# Altium schematic sheet STM32G474RBT6.SchDoc
size A3; SheetNumber: 2; SheetTotal: 4
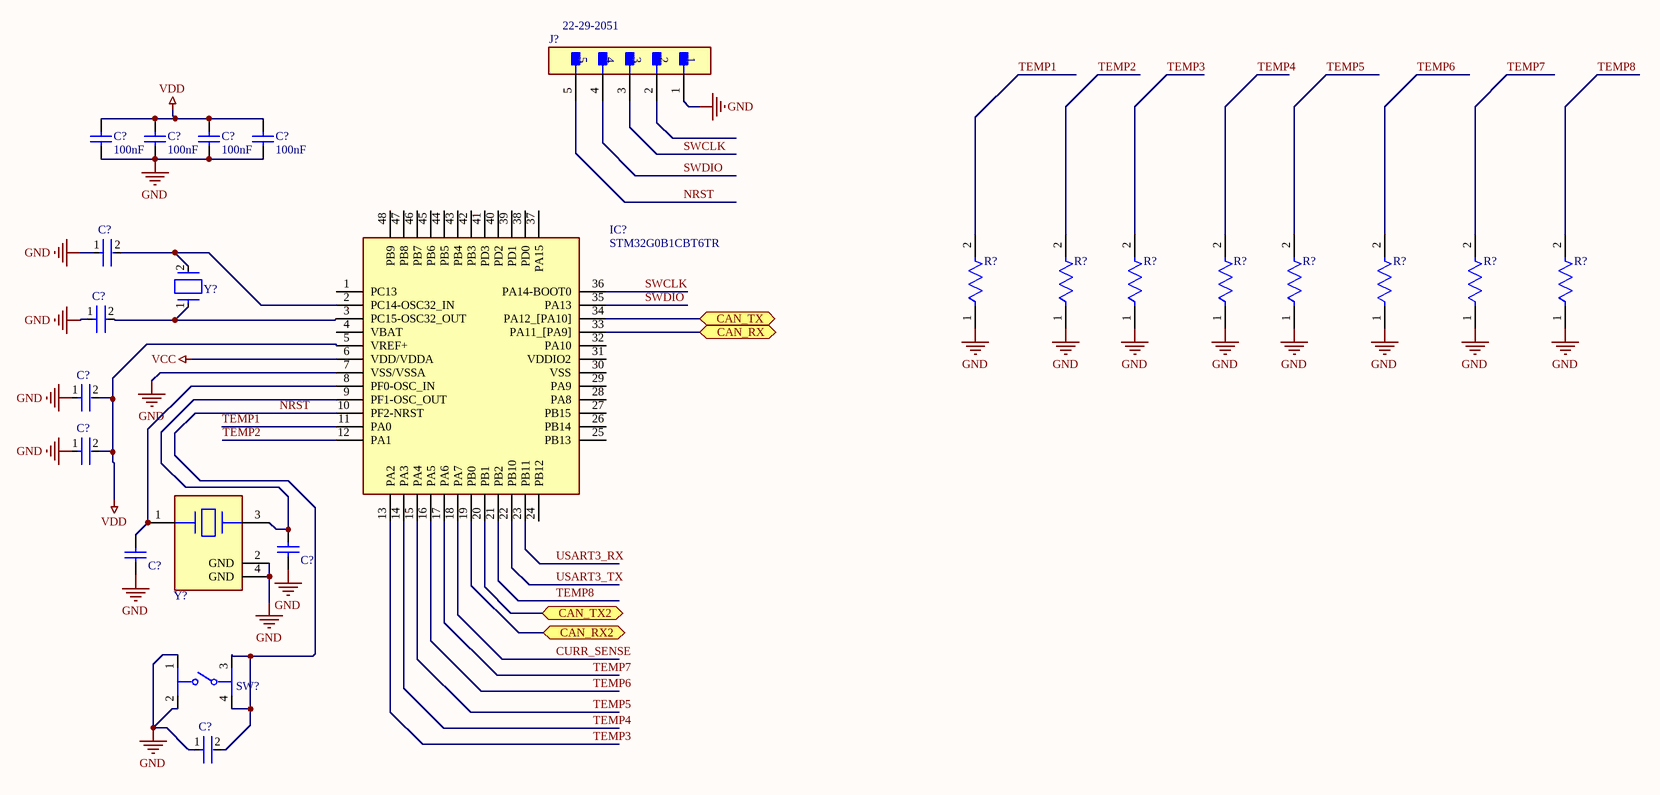
[diagram p0: STM32G474RBT6.SchDoc]

## Parts
(Parts that share a designator on the sheet are numbered #1, #2 ... from top to bottom, then left to right.)
C?#1  value 100nF  [C0402]
C?#2  value 100nF  [C0402]
C?#3  value 100nF  [C0402]
C?#4  value 100nF  [C0402]
C?#5  C0805C519D3HACTU  [FP-C0805C-DN-MFG]  (value not drawn)
C?#6  C0805C519D3HACTU  [FP-C0805C-DN-MFG]  (value not drawn)
C?#7  C0805C104K5RACTU  [FP-C0805C-DN-MFG]  (value not drawn)
C?#8  C0805C104K5RACTU  [FP-C0805C-DN-MFG]  (value not drawn)
C?#9  GRM1885C1H100JA01D  [CAPC1608X90X35LL10T15]  (value not drawn)
C?#10  GRM1885C1H100JA01D  [CAPC1608X90X35LL10T15]  (value not drawn)
C?#11  C0805C104K5RACTU  [FP-C0805C-DN-MFG]  (value not drawn)
IC?  STM32G0B1CBT6TR  [QFP50P900X900X160-48N]
J?  22-29-2051  [FP-22-29-2051-MFG]
R?#1  CRGCQ0805J10K  [FP-CRGCQ0805-IPC_C]  (value not drawn)
R?#2  CRGCQ0805J10K  [FP-CRGCQ0805-IPC_C]  (value not drawn)
R?#3  CRGCQ0805J10K  [FP-CRGCQ0805-IPC_C]  (value not drawn)
R?#4  CRGCQ0805J10K  [FP-CRGCQ0805-IPC_C]  (value not drawn)
R?#5  CRGCQ0805J10K  [FP-CRGCQ0805-IPC_C]  (value not drawn)
R?#6  CRGCQ0805J10K  [FP-CRGCQ0805-IPC_C]  (value not drawn)
R?#7  CRGCQ0805J10K  [FP-CRGCQ0805-IPC_C]  (value not drawn)
R?#8  CRGCQ0805J10K  [FP-CRGCQ0805-IPC_C]  (value not drawn)
SW?  PTS647SK38SMTR2LFS  [FP-PTS647SK38SMTR2LFS-MFG]  (value not drawn)
Y?#1  ABS06-32.768KHZ-9-1-T  [FP-ABS06-MFG]  (value not drawn)
Y?#2  ABM8G-24.000MHZ-B4Y-T  [FP-ABM8G-MFG]  (value not drawn)

## Ports
CAN_RX2 (bidir), CAN_RX (bidir), CAN_TX2 (bidir), CAN_TX (bidir)

## Nets
GND: C?#1.1 C?#2.1 C?#3.1 C?#4.1 C?#5.1 C?#6.1 C?#7.1 C?#8.1 C?#9.1 C?#10.1 C?#11.1 IC?.7(VSS/VSSA) J?.1 R?#1.1 R?#2.1 R?#3.1 R?#4.1 R?#5.1 R?#6.1 R?#7.1 R?#8.1 SW?.1 SW?.2 Y?#2.2(GND) Y?#2.4(GND)
VCC: IC?.6(VDD/VDDA)
VDD: C?#1.2 C?#2.2 C?#3.2 C?#4.2 C?#7.2 C?#8.2 IC?.5(VREF+)
CAN_RX: IC?.33(PA11_[PA9]) ; port CAN_RX
CAN_RX2: IC?.19(PB0) ; port CAN_RX2
CAN_TX: IC?.34(PA12_[PA10]) ; port CAN_TX
CAN_TX2: IC?.20(PB1) ; port CAN_TX2
CURR_SENSE: IC?.18(PA7)
NRST: C?#11.2 IC?.10(PF2-NRST) J?.5 SW?.3 SW?.4
SWCLK: IC?.36(PA14-BOOT0) J?.3
SWDIO: IC?.35(PA13) J?.4
TEMP1: IC?.11(PA0) R?#1.2
TEMP2: IC?.12(PA1) R?#2.2
TEMP3: IC?.13(PA2) R?#3.2
TEMP4: IC?.14(PA3) R?#4.2
TEMP5: IC?.15(PA4) R?#5.2
TEMP6: IC?.16(PA5) R?#6.2
TEMP7: IC?.17(PA6) R?#7.2
TEMP8: IC?.21(PB2) R?#8.2
USART3_RX: IC?.23(PB11)
USART3_TX: IC?.22(PB10)
NetC?#5_2: C?#5.2 IC?.2(PC14-OSC32_IN) Y?#1.2
NetC?#6_2: C?#6.2 IC?.3(PC15-OSC32_OUT) Y?#1.1
NetC?#9_2: C?#9.2 IC?.9(PF1-OSC_OUT) Y?#2.3
NetC?#10_2: C?#10.2 IC?.8(PF0-OSC_IN) Y?#2.1

Not connected (* = marked no-connect by the designer): IC? 1(PC13) 4(VBAT) 24(PB12) 25(PB13) 26(PB14) 27(PB15) 28(PA8) 29(PA9) 30(VSS) 31(VDDIO2) 32(PA10) 37(PA15) 38(PD0) 39(PD1) 40(PD2) 41(PD3) 42(PB3) 43(PB4) 44(PB5) 45(PB6) 46(PB7) 47(PB8) 48(PB9); J? 2

## Library data of the parts
C?#1-C?#4 = MCD-00102: Capacitor, MLCC, 100nF, 16V, X7R, 10%, 0402, T=0,5mm; Manufacturer_Part_Number: CC0402KRX7R7BB104; Manufacturer: YAGEO; Provided_By: Subcon; Initial_Board_Reference: MB1262; Internal_Part_Number: MCD-00102; Status: Released; Package: C0402; ComponentLink1Description: Yageo_Capacitor_X7R-series.pdf; ECCN_US: n/a; ECCN_EU: n/a; Part_Type: Capacitor; ComponentLink1URL: http://tunmcdsvn.tun.st.com/Component_Datasheet_Library/Trunk/Capacitors/Yageo_Multilayer_Capacitor_X7R_series_100pF_to_22uF
C?#5 C?#6 = CMP-03020-033346-1: C0805 5.1 pF X8R 30ppm/°C 0.5 pF 25 V; Manufacturer: KEMET; Voltage Rating: 25 V; Tolerance: 0.5 pF; Capacitance: 5.1 pF; Value: 5.1 pF; Material: Ceramic; Category: Cap; Lead Free: Yes; Temperature Characteristic: X8R; Manufacturer Part Number: C0805C519D3HACTU; Ipc Land Pattern Name: CAPC200125X78; ComponentLink2Description: Datasheet; Package: C0805C-DN; Device Class L2: Capacitors; Automotive: No; Octopart: https://octopart.com/c0805c519d3hactu-kemet-88727353; Device Class L1: Passive Components; Temperature Coefficient: 30ppm/°C; Temperature Range High: +125°C; Height: 0.88mm; Temperature Range Low: -55°C; ComponentLink2URL: https://content.kemet.com/datasheets/KEM_C1003_C0G_SMD.pdf; Device Class L3: Ceramic Capacitors; RoHS: TRUE; Temperature: -55°C to +125°C
C?#7 C?#8 C?#11 = CMP-2007-00279-2: CAP CER 0.1UF 50V X7R 0805; Manufacturer: KEMET; Value: 0.10 μF; Tolerance: 0.1; Temperature Coefficient: 30ppm/°C; Material: Ceramic; Manufacturer Part Number: C0805C104K5RACTU; Device Class L2: Capacitors; Temperature Range Low: -55°C; Voltage Rating: 50 V; Digikey Description: CAP CER 0.1UF 50V X7R 0805; Category: Cap; ComponentLink2Description: Datasheet; Octopart: https://octopart.com/c0805c104k5ractu-kemet-143926; RoHS: TRUE; ComponentLink2URL: https://content.kemet.com/datasheets/KEM_C1003_C0G_SMD.pdf; Temperature Characteristic: X7R; Temperature: -55°C to +125°C; Height: 0.88mm; Temperature Range High: +125°C; Device Class L1: Passive Components; Automotive: No; Lead Free: Yes; Ipc Land Pattern Name: CAPC200125X78; Device Class L3: Ceramic Capacitors; Mouser Description: Cap Ceramic 0.1uF 50V X7R 10% SMD 2.0 x 1.2 mm 125 C Paper T/R; Capacitance: 0.10 μF; Package: C0805C-DN
C?#9 C?#10 = CMP-2006-02592-1: Manufacturer: Murata; Part Number: GRM1885C1H100JA01D
IC? = STM32G0B1CBT6TR: Integrated Circuit; Manufacturer_Name: STMicroelectronics; Datasheet Link: https://www.st.com/resource/en/datasheet/stm32g0b1cc.pdf; Height: 1.6mm; Manufacturer_Part_Number: STM32G0B1CBT6TR; Mouser Part Number: 511-STM32G0B1CBT6TR; Mouser Price/Stock: https://www.mouser.co.uk/ProductDetail/STMicroelectronics/STM32G0B1CBT6TR?qs=HoCaDK9Nz5cqFCA6TLpp%252Bw%3D%3D; Arrow Part Number: STM32G0B1CBT6TR; Arrow Price/Stock: https://www.arrow.com/en/products/stm32g0b1cbt6tr/stmicroelectronics?utm_currency=USD&region=nac
J? = CMP-04776-000816-1: 2.54MM KK HDR VT FRICLK VRA .5AU; Manufacturer: Molex; Number of Circuits: 5; Connector Type: Male Pin; Max Current Rating: 7A; Glow Wire Compliant: Non-compliant; Insulation Resistance: 50GR; Gender: Male; Current Rating: 4A; Number of Lines: 1; Max Voltage Rating (AC): 250V; Contact Resistance: 10mR; Orientation: Straight; Height: 14.73mm; Contact Plating: Gold; Series: KK® 6410; Number of Poles: 5; Mount: Through Hole; Length: 12.7mm; Packaging: Bulk; Package Quantity: 10; Depth: 5.8mm; Housing Color: White; Pitch: 2.54mm; Number of Positions: 5; Contact Mating Length: 0.295inch; Max Operating Temperature: 75°C; Housing Material: Nylon; Termination: Solder; Contact Material: Brass; Flammability Rating: UL94 V-0; Number of Contacts: 5; Color: Natural; Min Operating Temperature: 0°C; Radiation Hardening: No; Contact Type: Male Pin; Number of Rows: 1; Voltage Rating: 250V; Voltage Rating (DC): 250V; Contact Gender: Male; Fastening Type: Friction; Lead Free: Lead Free; Halogen Free: Low Halogen; Manufacturer Part Number: 22-29-2051
R?#1-R?#8 = CMP-03211-002989-1: CRGCQ 0805 10K 5%; Manufacturer: TE Connectivity; Voltage Rating: 150V; Temperature Coefficient: ±100ppm/°C; Resistance: 10KΩ; Value: 10KΩ; Power Rating: 0.125W; Tolerance: 0.05; Automotive Grade: Grade 914; Height: 0.65mm; Lead Free: Yes; Temperature Range High: +155°C; Composition: Thick Film; Temperature Range Low: -55°C; Ambient Temperature Range High: +70°C; Temperature: -55°C to +155°C; Package: CRGCQ0805; Device Class L2: Resistors; RoHS: TRUE; ComponentLink2URL: https://www.te.com/commerce/DocumentDelivery/DDEController?Action=showdoc&DocId=Data+Sheet%7F1773204-3%7F1%7Fpdf%7FEnglish%7FENG_DS_1773204-3_1.pdf%7F4-2176341-923; Manufacturer Part Number: CRGCQ0805J10K; Series: CRGCQ; Device Class L1: Passive Components; Ipc Land Pattern Name: RESC200125X55; ComponentLink2Description: Datasheet; Category: Res; Digikey Description: CRGCQ 0805 10K 5%; Mouser Description: Res Thick Film 0805 10K Ohm 5% 0.125W(1/8W) ±100ppm/C Pad SMD Automotive T/R; Automotive: Yes; Octopart: https://octopart.com/crgcq0805j10k-te+connectivity-91018201; Device Class L3: Chip SMD Resistors
SW? = CMP-10040-000033-1: TACT 4.5 X 4.5, 3.8 MM H, 2.5N,; Switch Function: Off-Mom; Switch Travel: 0.25mm; Actuator Type: Standard; Illumination Type: Non-Illuminated; Mechanical Life: 100000Cycles; Ratings: IP40; Operating Force: 250gf; Throw Configuration: SPST; Max Operating Temperature: 70°C; Min Operating Temperature: -20°C; Termination: Gull Wing; Mount: Surface Mount; Packaging: Tape and Reel
Y?#1 = CMP-27762-003430-2: Crystal 32.768kHz ±10ppm (Tol) 9pF FUND 90kΩ 2-Pin Mini-CSMD T/R; Series Resistance: 90kR; Series: ABS06; Case/Package: CSMD; Package Quantity: 3000; Load Capacitance: 9pF; Number of Pins: 2; Tolerance: 10ppm; RoHS Compliant: Yes; Depth: 1.2mm; Termination: SMD/SMT; Min Operating Temperature: -40°C; Length: 2mm; Packaging: Tape and Reel; Max Operating Temperature: 85°C; Frequency Tolerance: 10ppm; Width: 1.2mm; ESR (Equivalent Series Resistance): 90kR; Radiation Hardening: No; Frequency: 32.768kHz; REACH SVHC: No SVHC; Mount: Surface Mount; Height: 0.6mm
Y?#2 = CMP-27762-015229-1: Crystal 24MHz ±30ppm (Tol) ±30ppm (Stability) 10pF FUND 60Ω 4-Pin SMD T/R; Series Resistance: 60R; Width: 2.5mm; Case/Package: CSMD; Load Capacitance: 10pF; Max Operating Temperature: 70°C; Depth: 2.5mm; Min Operating Temperature: -20°C; Frequency Stability: 30ppm; Frequency Tolerance: 30ppm; Frequency: 24MHz; Length: 3.2mm; Height: 1mm; Mount: Surface Mount; Lead Free: Lead Free; Tolerance: 30ppm; ESR (Equivalent Series Resistance): 60R; Number of Pins: 4; Termination: SMD/SMT; Operating Frequency: 24 MHz; Package Quantity: 1000; Series: ABM8G; Packaging: Tape and Reel